# Altium project BatterySentinel-N2K-Orion-R5.PrjPcb
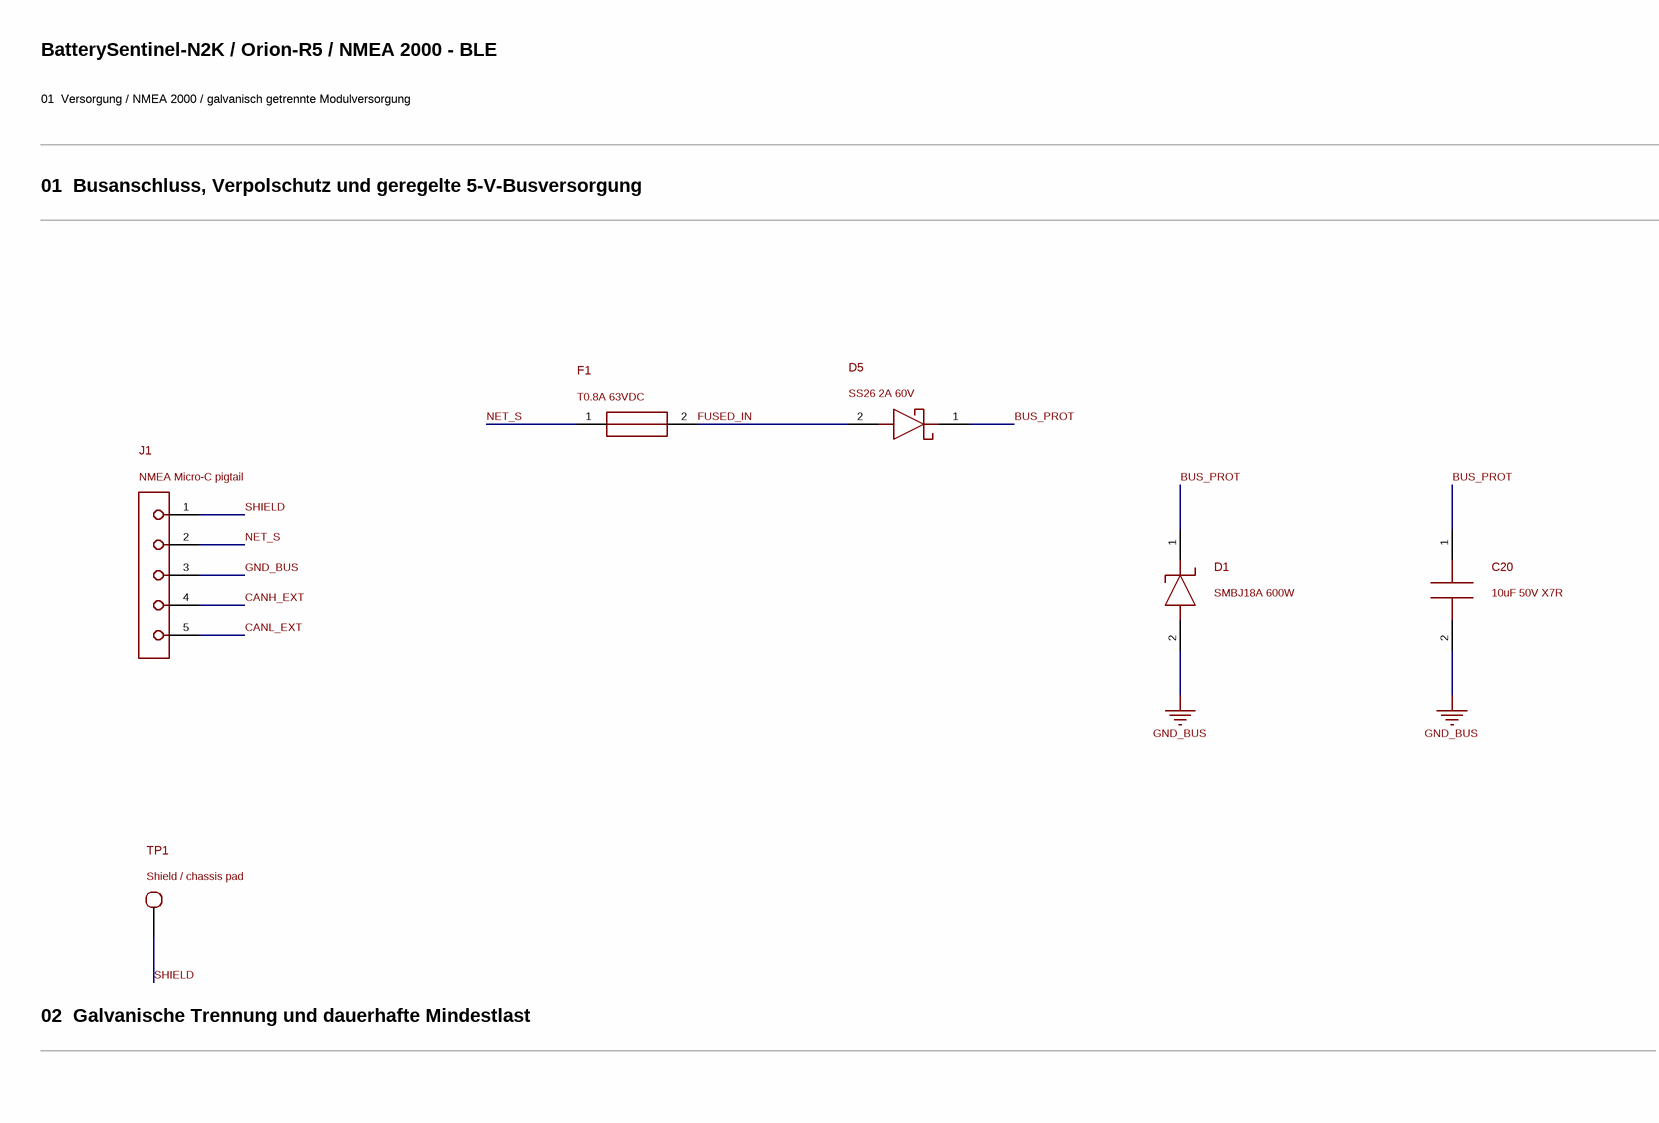
[diagram p0: BatterySentinel-N2K-Orion-R5-Power.SchDoc, top left]
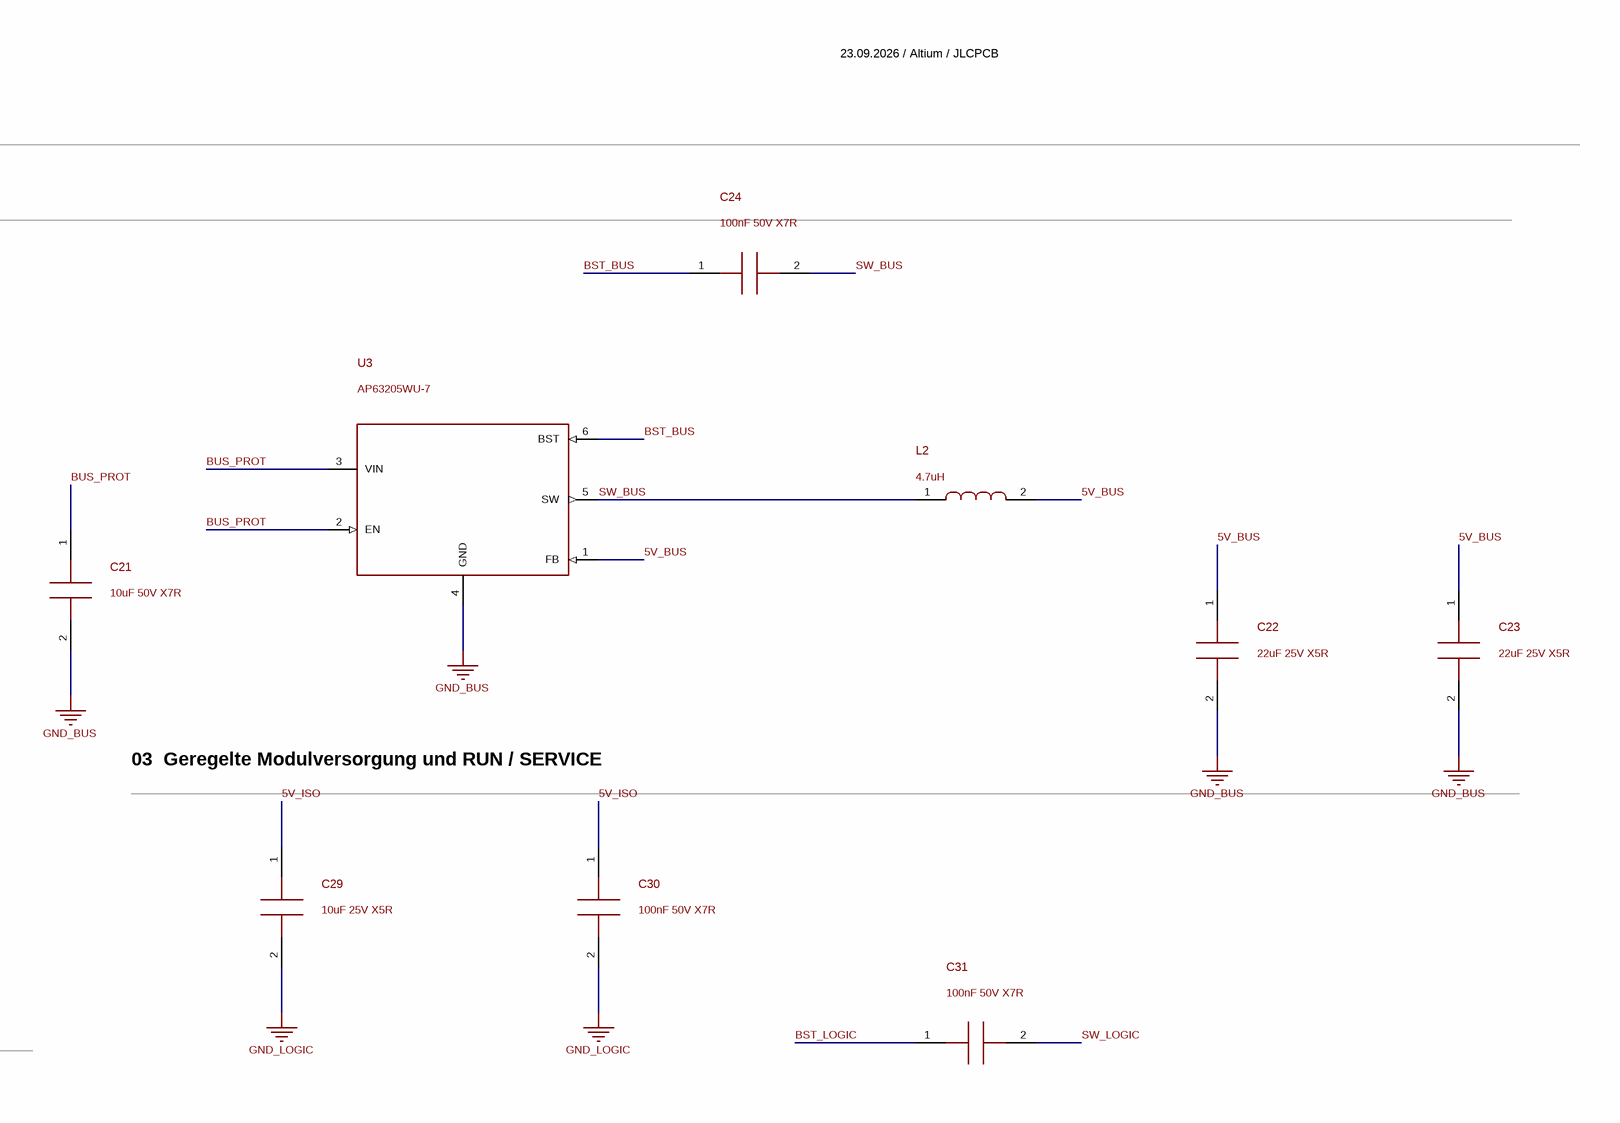
[diagram p1: BatterySentinel-N2K-Orion-R5-Power.SchDoc, top right]
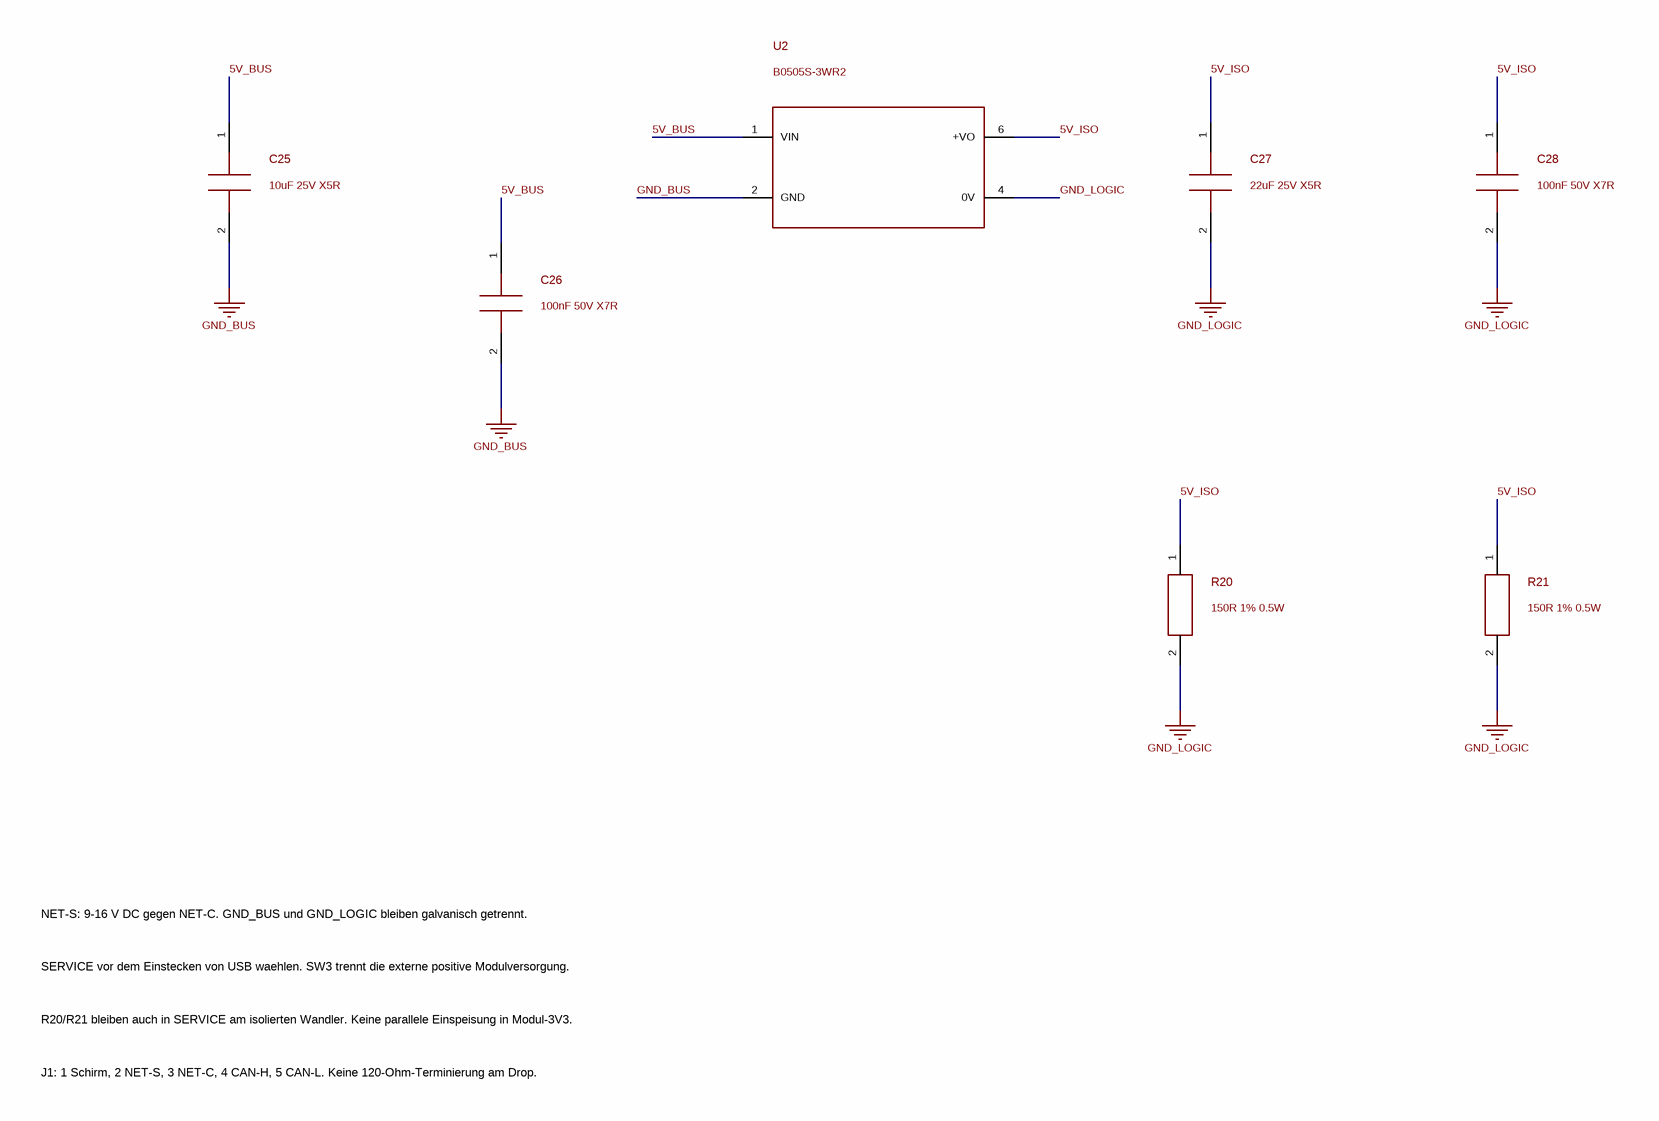
[diagram p2: BatterySentinel-N2K-Orion-R5-Power.SchDoc, bottom left]
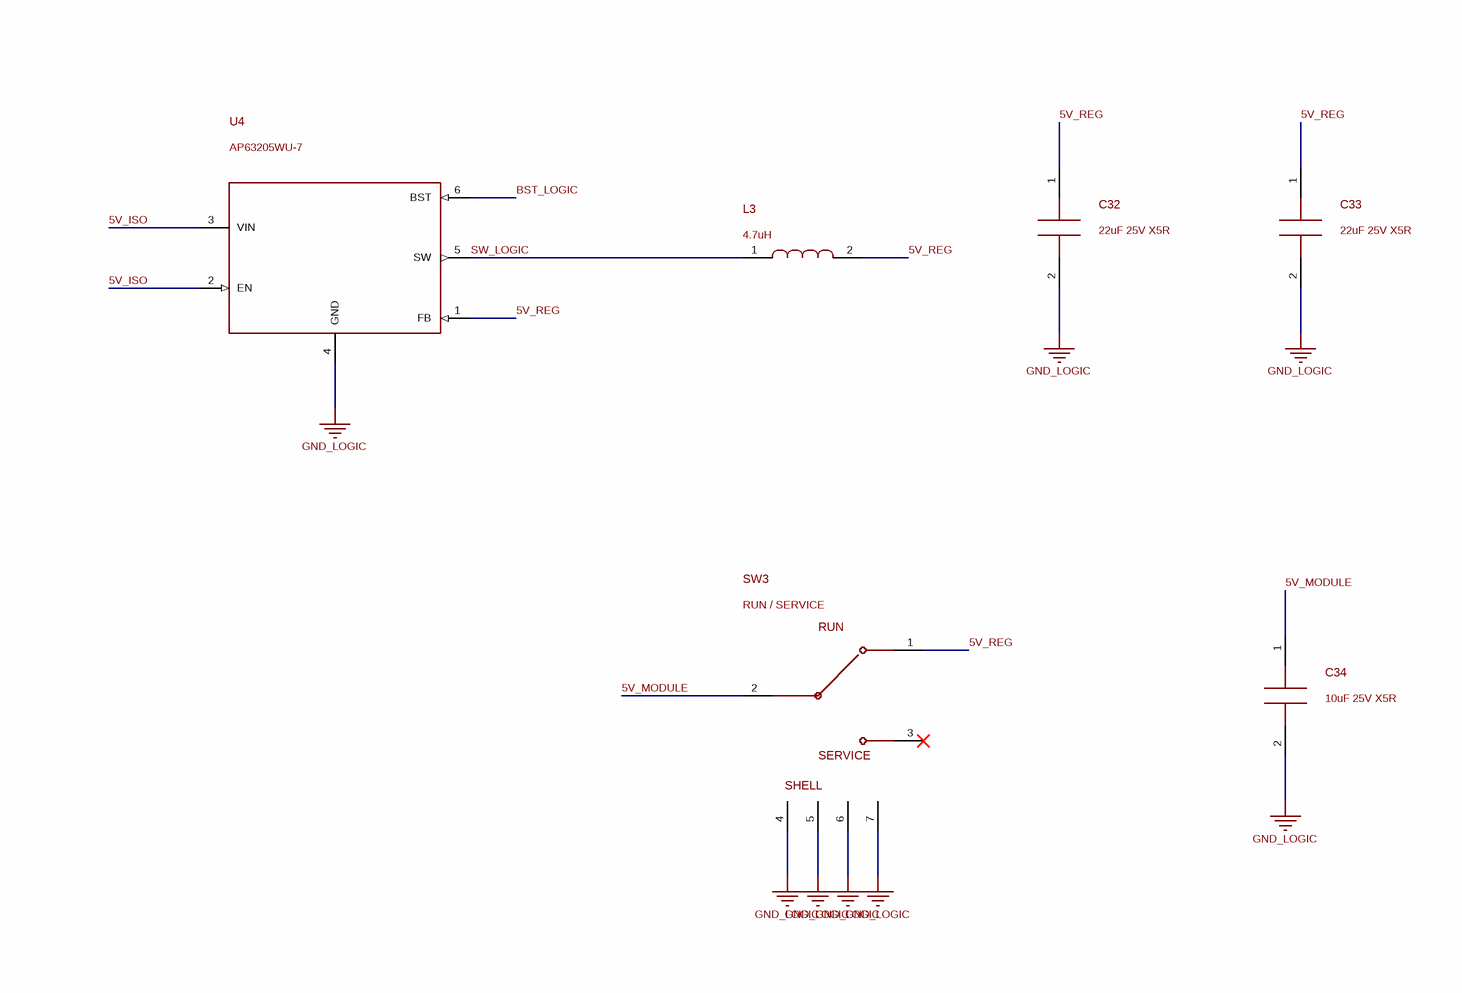
[diagram p3: BatterySentinel-N2K-Orion-R5-Power.SchDoc, bottom right]
2 sheets, 37 parts. Net scope: global (net labels, ports and power ports of the same name join across sheets).
Board file: BatterySentinel-N2K-Orion-R5.PcbDoc
Sheets:
  BatterySentinel-N2K-Orion-R5-Power.SchDoc
  BatterySentinel-N2K-Orion-R5-Logic.SchDoc

## Sheet BatterySentinel-N2K-Orion-R5-Power.SchDoc
size A2

### Parts
C20  10uF 50V X7R  [C1210]
C21  10uF 50V X7R  [C1210]
C22  22uF 25V X5R  [C1206]
C23  22uF 25V X5R  [C1206]
C24  100nF 50V X7R  [C0603]
C25  10uF 25V X5R  [C0805]
C26  100nF 50V X7R  [C0603]
C27  22uF 25V X5R  [C1206]
C28  100nF 50V X7R  [C0603]
C29  10uF 25V X5R  [C0805]
C30  100nF 50V X7R  [C0603]
C31  100nF 50V X7R  [C0603]
C32  22uF 25V X5R  [C1206]
C33  22uF 25V X5R  [C1206]
C34  10uF 25V X5R  [C0805]
D1  SMBJ18A 600W  [SMB]
D5  SS26 2A 60V  [SMA]
F1  T0.8A 63VDC  [BOURNS_SF1206S]
J1  NMEA Micro-C pigtail  [PIGTAIL_5_P3_D1P3]
L2  4.7uH  [SUNLORD_SWPA4030]
L3  4.7uH  [SUNLORD_SWPA4030]
R20  150R 1% 0.5W  [R1206]
R21  150R 1% 0.5W  [R1206]
SW3  RUN / SERVICE  [GSWITCH_MK12C02_G020]
TP1  Shield / chassis pad  [TESTPOINT_2MM]
U2  B0505S-3WR2  [EVISUN_B0505S_3WR2]
U3  AP63205WU-7  [TSOT26_DIODES]
U4  AP63205WU-7  [TSOT26_DIODES]

### Nets
GND_BUS: C20.2 C21.2 C22.2 C23.2 C25.2 C26.2 D1.2(A) J1.3(NET-C) U2.2(GND) U3.4(GND)
GND_LOGIC: C27.2 C28.2 C29.2 C30.2 C32.2 C33.2 C34.2 R20.2 R21.2 SW3.4(SHIELD1) SW3.5(SHIELD2) SW3.6(SHIELD3) SW3.7(SHIELD4) U2.4(0V) U4.4(GND)
5V_BUS: C22.1 C23.1 C25.1 C26.1 L2.2 U2.1(VIN) U3.1(FB)
5V_ISO: C27.1 C28.1 C29.1 C30.1 R20.1 R21.1 U2.6(+VO) U4.2(EN) U4.3(VIN)
5V_MODULE: C34.1 SW3.2(COMMON)
5V_REG: C32.1 C33.1 L3.2 SW3.1(RUN_IN) U4.1(FB)
BST_BUS: C24.1 U3.6(BST)
BST_LOGIC: C31.1 U4.6(BST)
BUS_PROT: C20.1 C21.1 D1.1(K) D5.1(K) U3.2(EN) U3.3(VIN)
CANH_EXT: J1.4(CAN-H)
CANL_EXT: J1.5(CAN-L)
FUSED_IN: D5.2(A) F1.2
NET_S: F1.1 J1.2(NET-S)
SHIELD: J1.1(SHIELD) TP1.1(SHIELD)
SW_BUS: C24.2 L2.1 U3.5(SW)
SW_LOGIC: C31.2 L3.1 U4.5(SW)

Not connected (* = marked no-connect by the designer): SW3 3(SERVICE_NC)*

### Notes on the sheet
- BatterySentinel-N2K / Orion-R5 / NMEA 2000 - BLE
- 23.09.2026 / Altium / JLCPCB
- 01  Versorgung / NMEA 2000 / galvanisch getrennte Modulversorgung
- 01  Busanschluss, Verpolschutz und geregelte 5-V-Busversorgung
- 03  Geregelte Modulversorgung und RUN / SERVICE
- 02  Galvanische Trennung und dauerhafte Mindestlast
- NET-S: 9-16 V DC gegen NET-C. GND_BUS und GND_LOGIC bleiben galvanisch getrennt.
- SERVICE vor dem Einstecken von USB waehlen. SW3 trennt die externe positive Modulversorgung.
- R20/R21 bleiben auch in SERVICE am isolierten Wandler. Keine parallele Einspeisung in Modul-3V3.
- J1: 1 Schirm, 2 NET-S, 3 NET-C, 4 CAN-H, 5 CAN-L. Keine 120-Ohm-Terminierung am Drop.
- (in symbol R5_SW3_RUN) RUN; SERVICE; SHELL

### Library data of the parts
C20 = R5_C20_10uF: Manufacturer: Samsung Electro-Mechanics; MPN: CL32B106KBJNNNE; ReviewStatus: R5 placement with enclosure interface; Manufacturer Part Number: CL32B106KBJNNNE; Description: 10uF 50V X7R; Datasheet: https://datasheet.lcsc.com/lcsc/1912112237_Samsung-Electro-Mechanics-CL32B106KBJNNNE_C138687.pdf; Supplier 1: LCSC; Supplier Part Number 1: C138687; Footprint Status: R5 placement with enclosure interface
C21 = R5_C21_10uF: Manufacturer: Samsung Electro-Mechanics; MPN: CL32B106KBJNNNE; ReviewStatus: R5 placement with enclosure interface; Manufacturer Part Number: CL32B106KBJNNNE; Description: 10uF 50V X7R; Datasheet: https://datasheet.lcsc.com/lcsc/1912112237_Samsung-Electro-Mechanics-CL32B106KBJNNNE_C138687.pdf; Supplier 1: LCSC; Supplier Part Number 1: C138687; Footprint Status: R5 placement with enclosure interface
C22 = R5_C22_22uF: Manufacturer: Samsung Electro-Mechanics; MPN: CL31A226KAHNNNE; ReviewStatus: R5 placement with enclosure interface; Manufacturer Part Number: CL31A226KAHNNNE; Description: 22uF 25V X5R; Datasheet: https://www.lcsc.com/datasheet/lcsc_datasheet_2304140030_Samsung-Electro-Mechanics-CL31A226KAHNNNE_C12891.pdf; Supplier 1: LCSC; Supplier Part Number 1: C12891; Footprint Status: R5 placement with enclosure interface
C23 = R5_C23_22uF: Manufacturer: Samsung Electro-Mechanics; MPN: CL31A226KAHNNNE; ReviewStatus: R5 placement with enclosure interface; Manufacturer Part Number: CL31A226KAHNNNE; Description: 22uF 25V X5R; Datasheet: https://www.lcsc.com/datasheet/lcsc_datasheet_2304140030_Samsung-Electro-Mechanics-CL31A226KAHNNNE_C12891.pdf; Supplier 1: LCSC; Supplier Part Number 1: C12891; Footprint Status: R5 placement with enclosure interface
C24 = R5_C24_100nF: Manufacturer: YAGEO; MPN: CC0603KRX7R9BB104; ReviewStatus: R5 placement with enclosure interface; Manufacturer Part Number: CC0603KRX7R9BB104; Description: 100nF 50V X7R; Datasheet: https://www.lcsc.com/datasheet/lcsc_datasheet_2211101700_YAGEO-CC0603KRX7R9BB104_C14663.pdf; Supplier 1: LCSC; Supplier Part Number 1: C14663; Footprint Status: R5 placement with enclosure interface
C25 = R5_C25_10uF: Manufacturer: Samsung Electro-Mechanics; MPN: CL21A106KAYNNNE; ReviewStatus: R5 placement with enclosure interface; Manufacturer Part Number: CL21A106KAYNNNE; Description: 10uF 25V X5R; Datasheet: https://www.lcsc.com/datasheet/lcsc_datasheet_2304140030_Samsung-Electro-Mechanics-CL21A106KAYNNNE_C15850.pdf; Supplier 1: LCSC; Supplier Part Number 1: C15850; Footprint Status: R5 placement with enclosure interface
C26 = R5_C26_100nF: Manufacturer: YAGEO; MPN: CC0603KRX7R9BB104; ReviewStatus: R5 placement with enclosure interface; Manufacturer Part Number: CC0603KRX7R9BB104; Description: 100nF 50V X7R; Datasheet: https://www.lcsc.com/datasheet/lcsc_datasheet_2211101700_YAGEO-CC0603KRX7R9BB104_C14663.pdf; Supplier 1: LCSC; Supplier Part Number 1: C14663; Footprint Status: R5 placement with enclosure interface
C27 = R5_C27_22uF: Manufacturer: Samsung Electro-Mechanics; MPN: CL31A226KAHNNNE; ReviewStatus: R5 placement with enclosure interface; Manufacturer Part Number: CL31A226KAHNNNE; Description: 22uF 25V X5R; Datasheet: https://www.lcsc.com/datasheet/lcsc_datasheet_2304140030_Samsung-Electro-Mechanics-CL31A226KAHNNNE_C12891.pdf; Supplier 1: LCSC; Supplier Part Number 1: C12891; Footprint Status: R5 placement with enclosure interface
C28 = R5_C28_100nF: Manufacturer: YAGEO; MPN: CC0603KRX7R9BB104; ReviewStatus: R5 placement with enclosure interface; Manufacturer Part Number: CC0603KRX7R9BB104; Description: 100nF 50V X7R; Datasheet: https://www.lcsc.com/datasheet/lcsc_datasheet_2211101700_YAGEO-CC0603KRX7R9BB104_C14663.pdf; Supplier 1: LCSC; Supplier Part Number 1: C14663; Footprint Status: R5 placement with enclosure interface
C29 = R5_C29_10uF: Manufacturer: Samsung Electro-Mechanics; MPN: CL21A106KAYNNNE; ReviewStatus: R5 placement with enclosure interface; Manufacturer Part Number: CL21A106KAYNNNE; Description: 10uF 25V X5R; Datasheet: https://www.lcsc.com/datasheet/lcsc_datasheet_2304140030_Samsung-Electro-Mechanics-CL21A106KAYNNNE_C15850.pdf; Supplier 1: LCSC; Supplier Part Number 1: C15850; Footprint Status: R5 placement with enclosure interface
C30 = R5_C30_100nF: Manufacturer: YAGEO; MPN: CC0603KRX7R9BB104; ReviewStatus: R5 placement with enclosure interface; Manufacturer Part Number: CC0603KRX7R9BB104; Description: 100nF 50V X7R; Datasheet: https://www.lcsc.com/datasheet/lcsc_datasheet_2211101700_YAGEO-CC0603KRX7R9BB104_C14663.pdf; Supplier 1: LCSC; Supplier Part Number 1: C14663; Footprint Status: R5 placement with enclosure interface
C31 = R5_C31_100nF: Manufacturer: YAGEO; MPN: CC0603KRX7R9BB104; ReviewStatus: R5 placement with enclosure interface; Manufacturer Part Number: CC0603KRX7R9BB104; Description: 100nF 50V X7R; Datasheet: https://www.lcsc.com/datasheet/lcsc_datasheet_2211101700_YAGEO-CC0603KRX7R9BB104_C14663.pdf; Supplier 1: LCSC; Supplier Part Number 1: C14663; Footprint Status: R5 placement with enclosure interface
C32 = R5_C32_22uF: Manufacturer: Samsung Electro-Mechanics; MPN: CL31A226KAHNNNE; ReviewStatus: R5 placement with enclosure interface; Manufacturer Part Number: CL31A226KAHNNNE; Description: 22uF 25V X5R; Datasheet: https://www.lcsc.com/datasheet/lcsc_datasheet_2304140030_Samsung-Electro-Mechanics-CL31A226KAHNNNE_C12891.pdf; Supplier 1: LCSC; Supplier Part Number 1: C12891; Footprint Status: R5 placement with enclosure interface
C33 = R5_C33_22uF: Manufacturer: Samsung Electro-Mechanics; MPN: CL31A226KAHNNNE; ReviewStatus: R5 placement with enclosure interface; Manufacturer Part Number: CL31A226KAHNNNE; Description: 22uF 25V X5R; Datasheet: https://www.lcsc.com/datasheet/lcsc_datasheet_2304140030_Samsung-Electro-Mechanics-CL31A226KAHNNNE_C12891.pdf; Supplier 1: LCSC; Supplier Part Number 1: C12891; Footprint Status: R5 placement with enclosure interface
C34 = R5_C34_10uF: 10uF local module5V reservoir after RUN/SERVICE switch; Manufacturer: Samsung Electro-Mechanics; MPN: CL21A106KAYNNNE; ReviewStatus: R5 placement with enclosure interface; Manufacturer Part Number: CL21A106KAYNNNE; Datasheet: https://www.lcsc.com/datasheet/lcsc_datasheet_2304140030_Samsung-Electro-Mechanics-CL21A106KAYNNNE_C15850.pdf; Supplier 1: LCSC; Supplier Part Number 1: C15850; Footprint Status: R5 placement with enclosure interface
D1 = R5_D1_SMBJ18A: Manufacturer: BORN; ReviewStatus: R5 placement with enclosure interface; MPN: SMBJ18A; Manufacturer Part Number: SMBJ18A; Description: SMBJ18A 600W; Datasheet: https://www.lcsc.com/datasheet/lcsc_datasheet_2304140030_BORN-SMBJ18A_C152104.pdf; Supplier 1: LCSC; Supplier Part Number 1: C152104; Footprint Status: R5 placement with enclosure interface
D5 = R5_D5_SS26: Manufacturer: MDD(Microdiode Semiconductor); ReviewStatus: R5 placement with enclosure interface; MPN: SS26; Manufacturer Part Number: SS26; Description: SS26 2A 60V; Datasheet: https://www.lcsc.com/datasheet/lcsc_datasheet_2407101107_MDD-Microdiode-Semiconductor-SS26_C14238.pdf; Supplier 1: LCSC; Supplier Part Number 1: C14238; Footprint Status: R5 placement with enclosure interface
F1 = R5_F1_T0.8A: 0.8 A slow-blow SMD ceramic fuse, 63 VDC, 50 A interrupt rating; Manufacturer: BOURNS; MPN: SF-1206S080-2; ReviewStatus: R5 placement with enclosure interface; Manufacturer Part Number: SF-1206S080-2; Datasheet: https://wmsc.lcsc.com/wmsc/upload/file/pdf/v2/lcsc/2304140030_BOURNS-SF-1206S080-2_C3032873.pdf; Supplier 1: LCSC; Supplier Part Number 1: C3032873; Footprint Status: R5 placement with enclosure interface
J1 = R5_J1_NMEA: Five direct wire-solder pads for a separately selected Micro-C cable; this is a PCB interface, not an invented connector MPN or face view; ReviewStatus: R5 placement with enclosure interface; Footprint Status: R5 placement with enclosure interface
L2 = R5_L2_4.7uH: Manufacturer: Sunlord; MPN: SWPA4030S4R7MT; ReviewStatus: R5 placement with enclosure interface; Manufacturer Part Number: SWPA4030S4R7MT; Description: 4.7uH; Datasheet: https://www.lcsc.com/datasheet/lcsc_datasheet_2310251551_Sunlord-SWPA4030S4R7MT_C57269.pdf; Supplier 1: LCSC; Supplier Part Number 1: C57269; Footprint Status: R5 placement with enclosure interface
L3 = R5_L3_4.7uH: Manufacturer: Sunlord; MPN: SWPA4030S4R7MT; ReviewStatus: R5 placement with enclosure interface; Manufacturer Part Number: SWPA4030S4R7MT; Description: 4.7uH; Datasheet: https://www.lcsc.com/datasheet/lcsc_datasheet_2310251551_Sunlord-SWPA4030S4R7MT_C57269.pdf; Supplier 1: LCSC; Supplier Part Number 1: C57269; Footprint Status: R5 placement with enclosure interface
R20 = R5_R20_150R: Manufacturer: SEI(Stackpole Elec); MPN: RNCP1206FTD150R; ReviewStatus: R5 placement with enclosure interface; Manufacturer Part Number: RNCP1206FTD150R; Description: 150R 1% 0.5W; Datasheet: https://wmsc.lcsc.com/wmsc/upload/file/pdf/v2/lcsc/2404111532_SEI-Stackpole-Elec-RNCP1206FTD150R_C4258541.pdf; Supplier 1: LCSC; Supplier Part Number 1: C4258541; Footprint Status: R5 placement with enclosure interface
R21 = R5_R21_150R: Manufacturer: SEI(Stackpole Elec); MPN: RNCP1206FTD150R; ReviewStatus: R5 placement with enclosure interface; Manufacturer Part Number: RNCP1206FTD150R; Description: 150R 1% 0.5W; Datasheet: https://wmsc.lcsc.com/wmsc/upload/file/pdf/v2/lcsc/2404111532_SEI-Stackpole-Elec-RNCP1206FTD150R_C4258541.pdf; Supplier 1: LCSC; Supplier Part Number 1: C4258541; Footprint Status: R5 placement with enclosure interface
SW3 = R5_SW3_RUN: Side-actuated SPDT service supply disconnect, 1A at6V, original SuperMini USB service; Manufacturer: G-Switch; MPN: MK-12C02-G020; ReviewStatus: R5 placement with enclosure interface; Manufacturer Part Number: MK-12C02-G020; Datasheet: https://static.chipdip.ru/lib/011/DOC043011829.pdf; Supplier 1: LCSC; Supplier Part Number 1: C963206; Footprint Status: R5 placement with enclosure interface
TP1 = R5_TP1_Shield: Shield / chassis pad - generic specification; manufacturer/MPN not selected; ReviewStatus: R5 placement with enclosure interface; Footprint Status: R5 placement with enclosure interface
U2 = R5_U2_B0505S_3WR2: Manufacturer: EVISUN; ReviewStatus: R5 placement with enclosure interface; MPN: B0505S-3WR2; Manufacturer Part Number: B0505S-3WR2; Description: B0505S-3WR2; Datasheet: https://wmsc.lcsc.com/wmsc/upload/file/pdf/v2/lcsc/2308311627_EVISUN-B0505S-3WR2_C7500927.pdf; Supplier 1: LCSC; Supplier Part Number 1: C7500927; Footprint Status: R5 placement with enclosure interface
U3 = R5_U3_AP63205WU_7: Manufacturer: Diodes Incorporated; ReviewStatus: R5 placement with enclosure interface; MPN: AP63205WU-7; Manufacturer Part Number: AP63205WU-7; Description: AP63205WU-7; Datasheet: https://www.lcsc.com/datasheet/lcsc_datasheet_2210280930_Diodes-Incorporated-AP63205WU-7_C2071056.pdf; Supplier 1: LCSC; Supplier Part Number 1: C2071056; Footprint Status: R5 placement with enclosure interface
U4 = R5_U4_AP63205WU_7: Isolated-side 5V buck / high-duty pass-through, feeding physical RUN/SERVICE disconnect; Manufacturer: Diodes Incorporated; ReviewStatus: R5 placement with enclosure interface; MPN: AP63205WU-7; Manufacturer Part Number: AP63205WU-7; Datasheet: https://www.lcsc.com/datasheet/lcsc_datasheet_2210280930_Diodes-Incorporated-AP63205WU-7_C2071056.pdf; Supplier 1: LCSC; Supplier Part Number 1: C2071056; Footprint Status: R5 placement with enclosure interface

## Sheet BatterySentinel-N2K-Orion-R5-Logic.SchDoc
size A2
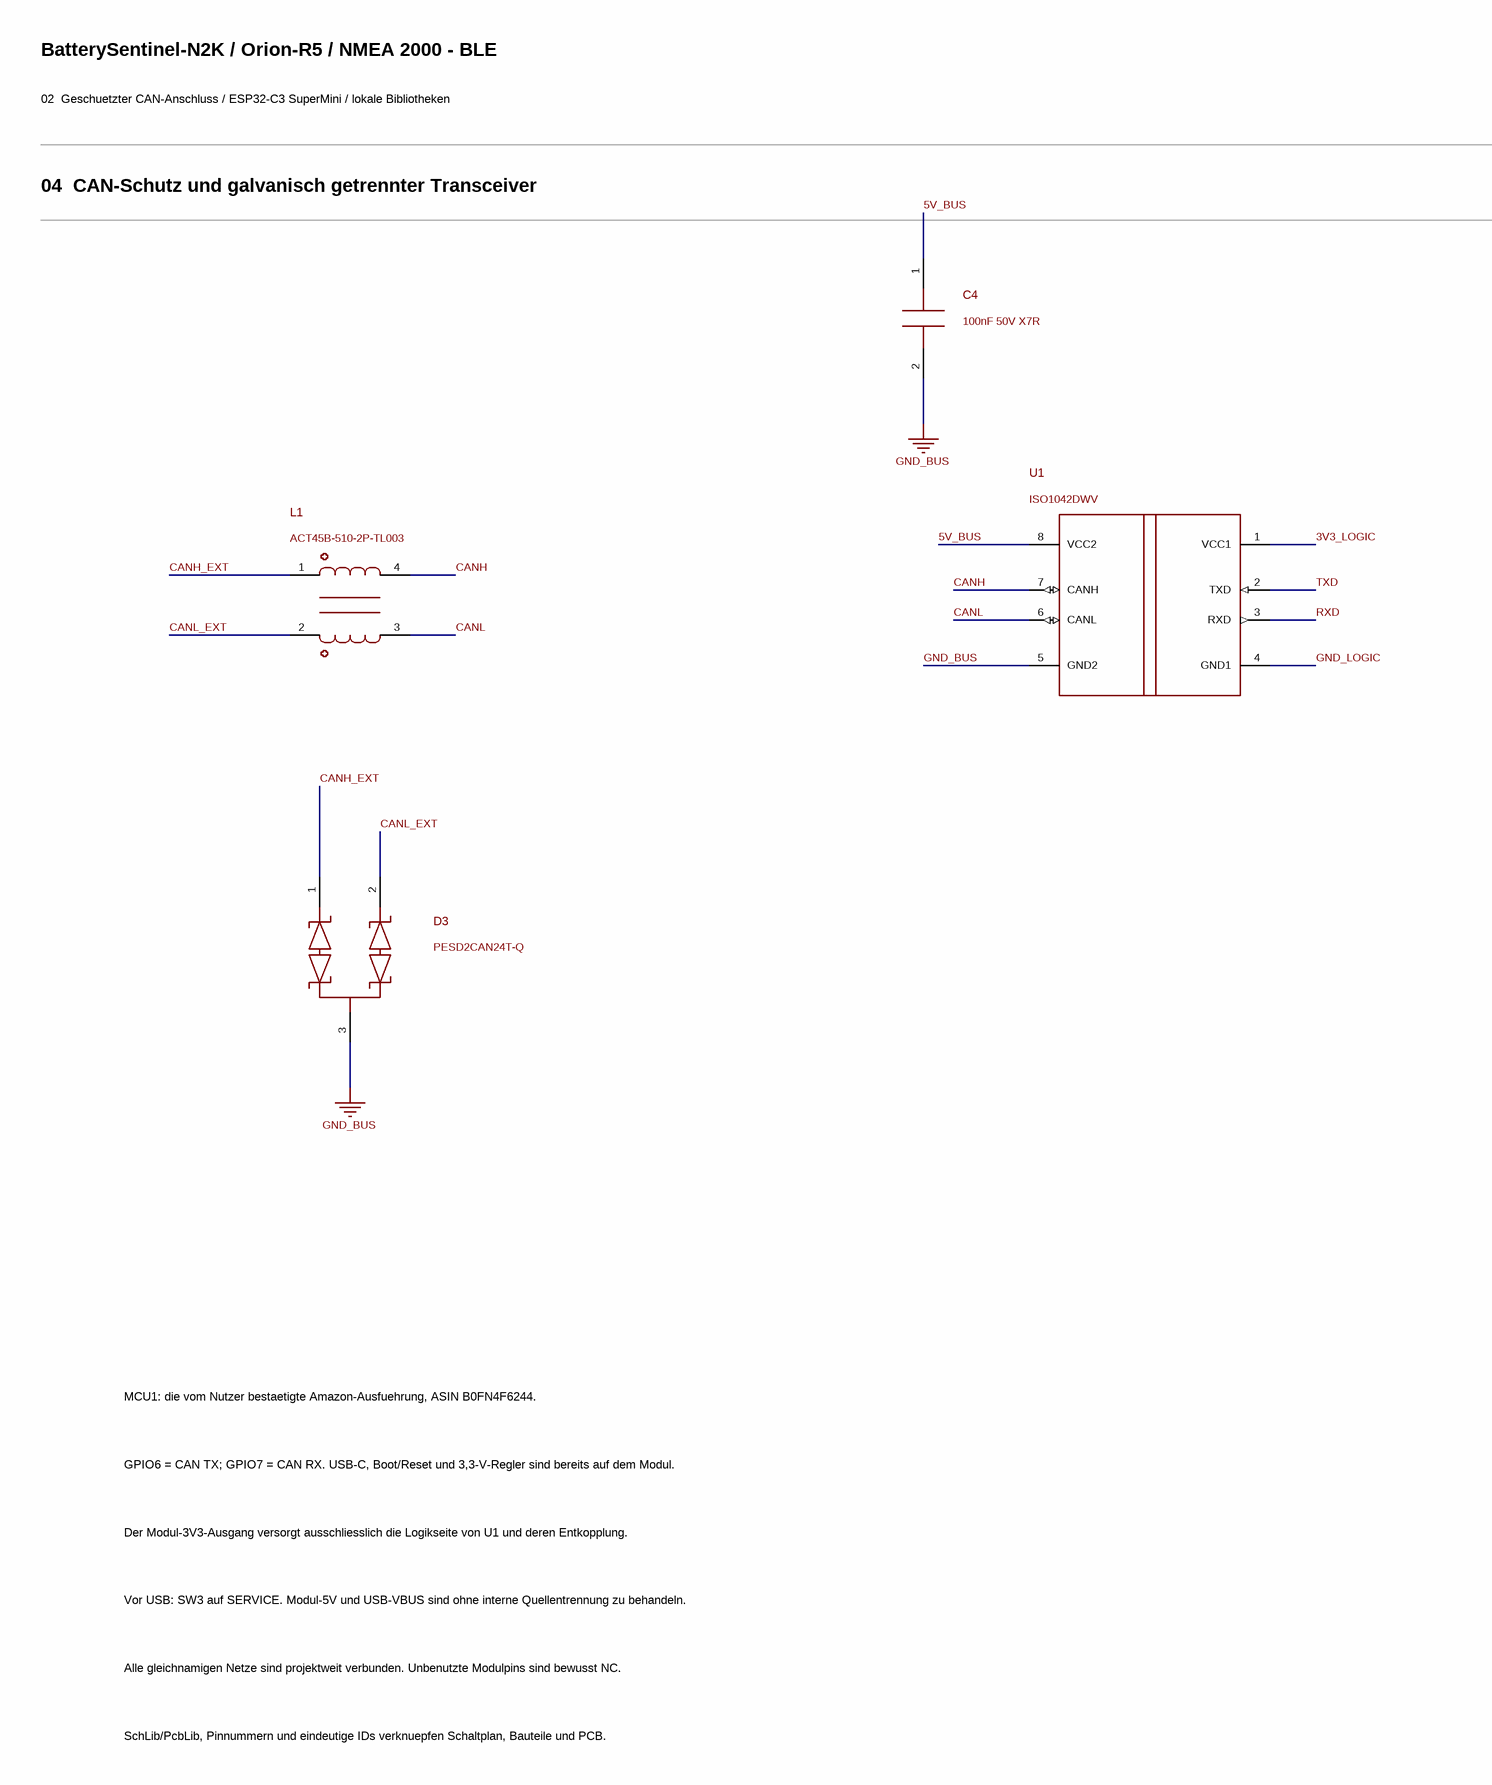
[diagram p4: BatterySentinel-N2K-Orion-R5-Logic.SchDoc, left]
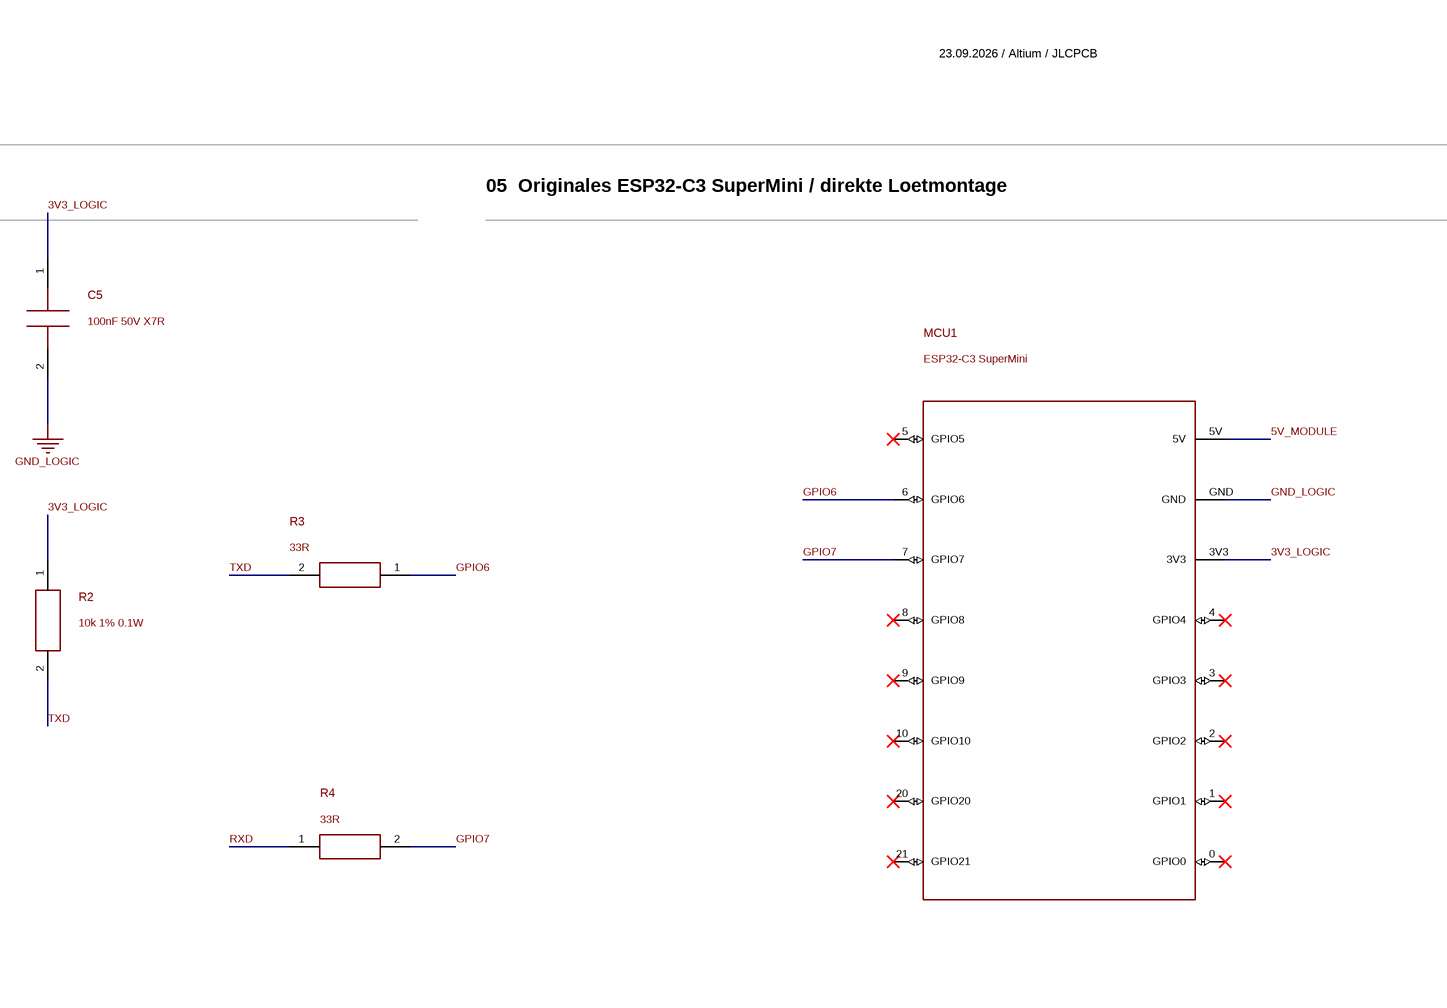
[diagram p5: BatterySentinel-N2K-Orion-R5-Logic.SchDoc, right]

### Parts
C4  100nF 50V X7R  [C0603]
C5  100nF 50V X7R  [C0603]
D3  PESD2CAN24T-Q  [SOT23_NEXPERIA_REFLOW]
L1  ACT45B-510-2P-TL003  [ACT45B]
MCU1  ESP32-C3 SuperMini  [SUPERC3_B0FN4F6244_CAST16_SMD]
R2  10k 1% 0.1W  [R0603]
R3  33R  [R0603]
R4  33R  [R0603]
U1  ISO1042DWV  [SOIC8_DWV]

### Nets
GND_BUS: C4.2 D3.3(CC) U1.5(GND2)
GND_LOGIC: C5.2 MCU1.GND U1.4(GND1)
3V3_LOGIC: C5.1 MCU1.3V3 R2.1 U1.1(VCC1)
5V_BUS: C4.1 U1.8(VCC2)
5V_MODULE: MCU1.5V
CANH: L1.4(H_IC) U1.7(CANH)
CANH_EXT: D3.1(K1) L1.1(H_EXT)
CANL: L1.3(L_IC) U1.6(CANL)
CANL_EXT: D3.2(K2) L1.2(L_EXT)
GPIO6: MCU1.6(GPIO6) R3.1
GPIO7: MCU1.7(GPIO7) R4.2
RXD: R4.1 U1.3(RXD)
TXD: R2.2 R3.2 U1.2(TXD)

Not connected (* = marked no-connect by the designer): MCU1 0(GPIO0)* 1(GPIO1)* 2(GPIO2)* 3(GPIO3)* 4(GPIO4)* 5(GPIO5)* 8(GPIO8)* 9(GPIO9)* 10(GPIO10)* 20(GPIO20)* 21(GPIO21)*

### Notes on the sheet
- BatterySentinel-N2K / Orion-R5 / NMEA 2000 - BLE
- 23.09.2026 / Altium / JLCPCB
- 02  Geschuetzter CAN-Anschluss / ESP32-C3 SuperMini / lokale Bibliotheken
- 04  CAN-Schutz und galvanisch getrennter Transceiver
- 05  Originales ESP32-C3 SuperMini / direkte Loetmontage
- MCU1: die vom Nutzer bestaetigte Amazon-Ausfuehrung, ASIN B0FN4F6244.
- GPIO6 = CAN TX; GPIO7 = CAN RX. USB-C, Boot/Reset und 3,3-V-Regler sind bereits auf dem Modul.
- Der Modul-3V3-Ausgang versorgt ausschliesslich die Logikseite von U1 und deren Entkopplung.
- Vor USB: SW3 auf SERVICE. Modul-5V und USB-VBUS sind ohne interne Quellentrennung zu behandeln.
- Alle gleichnamigen Netze sind projektweit verbunden. Unbenutzte Modulpins sind bewusst NC.
- SchLib/PcbLib, Pinnummern und eindeutige IDs verknuepfen Schaltplan, Bauteile und PCB.

### Library data of the parts
C4 = R5_C4_100nF: 100nF 16V X7R - generic specification; manufacturer/MPN not selected; Manufacturer: YAGEO; MPN: CC0603KRX7R9BB104; ReviewStatus: R5 placement with enclosure interface; Manufacturer Part Number: CC0603KRX7R9BB104; Datasheet: https://www.lcsc.com/datasheet/lcsc_datasheet_2211101700_YAGEO-CC0603KRX7R9BB104_C14663.pdf; Supplier 1: LCSC; Supplier Part Number 1: C14663; Footprint Status: R5 placement with enclosure interface
C5 = R5_C5_100nF: 100nF 16V X7R - generic specification; manufacturer/MPN not selected; Manufacturer: YAGEO; MPN: CC0603KRX7R9BB104; ReviewStatus: R5 placement with enclosure interface; Manufacturer Part Number: CC0603KRX7R9BB104; Datasheet: https://www.lcsc.com/datasheet/lcsc_datasheet_2211101700_YAGEO-CC0603KRX7R9BB104_C14663.pdf; Supplier 1: LCSC; Supplier Part Number 1: C14663; Footprint Status: R5 placement with enclosure interface
D3 = R5_D3_PESD2CAN24T_Q: Manufacturer: Nexperia; MPN: PESD2CAN24T-QR; ReviewStatus: R5 placement with enclosure interface; Manufacturer Part Number: PESD2CAN24T-QR; Description: PESD2CAN24T-Q; Datasheet: https://assets.nexperia.com/documents/data-sheet/PESD2CAN24T-Q.pdf; Supplier 1: LCSC; Supplier Part Number 1: C28933048; Footprint Status: R5 placement with enclosure interface
L1 = R5_L1_ACT45B_510_2P_TL003: Manufacturer: TDK; ReviewStatus: R5 placement with enclosure interface; MPN: ACT45B-510-2P-TL003; Manufacturer Part Number: ACT45B-510-2P-TL003; Description: ACT45B-510-2P-TL003; Datasheet: https://www.lcsc.com/datasheet/lcsc_datasheet_1811151430_TDK-ACT45B-510-2P-TL003_C76584.pdf; Supplier 1: LCSC; Supplier Part Number 1: C76584; Footprint Status: R5 placement with enclosure interface
MCU1 = R5_MCU1_ESP32_C3: User-selected C3 SuperMini; original onboard USB/BOOT/RESET; direct castellated solder mounting; Manufacturer: Meshnology (seller brand; OEM undisclosed); MPN: ESP32-C3 SuperMini / ASIN B0FN4F6244; ReviewStatus: R5 placement with enclosure interface; Manufacturer Part Number: ESP32-C3 SuperMini / ASIN B0FN4F6244; Datasheet: https://www.amazon.de/4PCS-Supermini-ESP32-C3-Entwicklungsboard/dp/B0FN4F6244; Footprint Status: R5 placement with enclosure interface
R2 = R5_R2_10k: 10k - generic specification; manufacturer/MPN not selected; Manufacturer: UNI-ROYAL(Uniroyal Elec); MPN: 0603WAF1002T5E; ReviewStatus: R5 placement with enclosure interface; Manufacturer Part Number: 0603WAF1002T5E; Datasheet: https://www.lcsc.com/datasheet/lcsc_datasheet_2206010045_UNI-ROYAL-Uniroyal-Elec-0603WAF1002T5E_C25804.pdf; Supplier 1: LCSC; Supplier Part Number 1: C25804; Footprint Status: R5 placement with enclosure interface
R3 = R5_R3_33R: 33R - generic specification; manufacturer/MPN not selected; Manufacturer: UNI-ROYAL(Uniroyal Elec); MPN: 0603WAF330JT5E; Role: R_TX; ReviewStatus: R5 placement with enclosure interface; Manufacturer Part Number: 0603WAF330JT5E; Datasheet: https://www.lcsc.com/datasheet/lcsc_datasheet_2206010116_UNI-ROYAL-Uniroyal-Elec-0603WAF330JT5E_C23140.pdf; Supplier 1: LCSC; Supplier Part Number 1: C23140; Footprint Status: R5 placement with enclosure interface
R4 = R5_R4_33R: 33R - generic specification; manufacturer/MPN not selected; Manufacturer: UNI-ROYAL(Uniroyal Elec); MPN: 0603WAF330JT5E; Role: R_RX; ReviewStatus: R5 placement with enclosure interface; Manufacturer Part Number: 0603WAF330JT5E; Datasheet: https://www.lcsc.com/datasheet/lcsc_datasheet_2206010116_UNI-ROYAL-Uniroyal-Elec-0603WAF330JT5E_C23140.pdf; Supplier 1: LCSC; Supplier Part Number 1: C23140; Footprint Status: R5 placement with enclosure interface
U1 = R5_U1_ISO1042DWV: Manufacturer: Texas Instruments; MPN: ISO1042DWVR; ReviewStatus: R5 placement with enclosure interface; Manufacturer Part Number: ISO1042DWVR; Description: ISO1042DWV; Datasheet: https://datasheet.lcsc.com/lcsc/2302212001_Texas-Instruments-ISO1042DWVR_C2671714.pdf; Supplier 1: LCSC; Supplier Part Number 1: C2671714; Footprint Status: R5 placement with enclosure interface

## Nets that join several sheets
GND_BUS: BatterySentinel-N2K-Orion-R5-Power (10 pins), BatterySentinel-N2K-Orion-R5-Logic (C4.2 D3.3 U1.5)
GND_LOGIC: BatterySentinel-N2K-Orion-R5-Power (15 pins), BatterySentinel-N2K-Orion-R5-Logic (C5.2 MCU1.GND U1.4)
5V_BUS: BatterySentinel-N2K-Orion-R5-Power (7 pins), BatterySentinel-N2K-Orion-R5-Logic (C4.1 U1.8)
5V_MODULE: BatterySentinel-N2K-Orion-R5-Power (C34.1 SW3.2), BatterySentinel-N2K-Orion-R5-Logic (MCU1.5V)
CANH_EXT: BatterySentinel-N2K-Orion-R5-Power (J1.4), BatterySentinel-N2K-Orion-R5-Logic (D3.1 L1.1)
CANL_EXT: BatterySentinel-N2K-Orion-R5-Power (J1.5), BatterySentinel-N2K-Orion-R5-Logic (D3.2 L1.2)